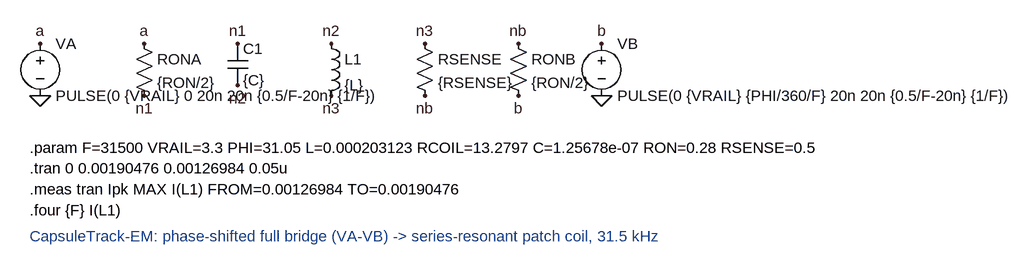
[diagram p0: schematic coil_driver_31.5kHz.asc]
coil_driver_31.5kHz.asc, the LTspice schematic file:
Version 4
SHEET 1 1120 520
FLAG 96 176 a
FLAG 96 256 0
FLAG 256 176 a
FLAG 256 256 n1
FLAG 400 176 n1
FLAG 400 240 n2
FLAG 544 176 n2
FLAG 544 256 n3
FLAG 688 176 n3
FLAG 688 256 nb
FLAG 832 176 nb
FLAG 832 256 b
FLAG 960 176 b
FLAG 960 256 0
SYMBOL voltage 96 160 R0
SYMATTR InstName VA
SYMATTR Value PULSE(0 {VRAIL} 0 20n 20n {0.5/F-20n} {1/F})
SYMBOL res 240 160 R0
SYMATTR InstName RONA
SYMATTR Value {RON/2}
SYMBOL cap 384 176 R0
SYMATTR InstName C1
SYMATTR Value {C}
SYMBOL ind 528 160 R0
SYMATTR InstName L1
SYMATTR Value {L}
SYMATTR SpiceLine Rser={RCOIL}
SYMBOL res 672 160 R0
SYMATTR InstName RSENSE
SYMATTR Value {RSENSE}
SYMBOL res 816 160 R0
SYMATTR InstName RONB
SYMATTR Value {RON/2}
SYMBOL voltage 960 160 R0
SYMATTR InstName VB
SYMATTR Value PULSE(0 {VRAIL} {PHI/360/F} 20n 20n {0.5/F-20n} {1/F})
TEXT 80 336 Left 2 !.param F=31500 VRAIL=3.3 PHI=31.05 L=0.000203123 RCOIL=13.2797 C=1.25678e-07 RON=0.28 RSENSE=0.5
TEXT 80 368 Left 2 !.tran 0 0.00190476 0.00126984 0.05u
TEXT 80 400 Left 2 !.meas tran Ipk MAX I(L1) FROM=0.00126984 TO=0.00190476
TEXT 80 432 Left 2 !.four {F} I(L1)
TEXT 80 472 Left 2 ;CapsuleTrack-EM: phase-shifted full bridge (VA-VB) -> series-resonant patch coil, 31.5 kHz

The netlist it stands for:
* coil_driver_31.5kHz.asc
VA a 0 PULSE(0 {VRAIL} 0 20n 20n {0.5/F-20n} {1/F})
RONA a n1 {RON/2}
C1 n1 n2 {C}
L1 n2 n3 {L} Rser={RCOIL}
RSENSE n3 nb {RSENSE}
RONB nb b {RON/2}
VB b 0 PULSE(0 {VRAIL} {PHI/360/F} 20n 20n {0.5/F-20n} {1/F})
.param F=31500 VRAIL=3.3 PHI=31.05 L=0.000203123 RCOIL=13.2797 C=1.25678e-07 RON=0.28 RSENSE=0.5
.tran 0 0.00190476 0.00126984 0.05u
.meas tran Ipk MAX I(L1) FROM=0.00126984 TO=0.00190476
.four {F} I(L1)
* CapsuleTrack-EM: phase-shifted full bridge (VA-VB) -> series-resonant patch coil, 31.5 kHz
.backanno
.end